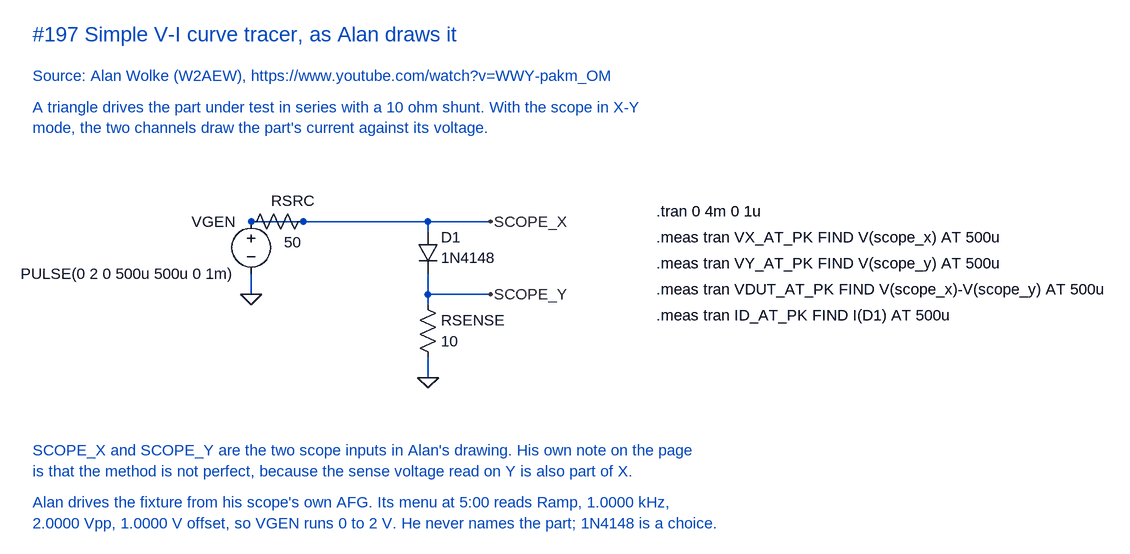
[diagram p0: schematic Diode V-I tracer.asc]
Diode V-I tracer.asc, the LTspice schematic file:
Version 4
SHEET 1 1900 1000
WIRE 496 288 576 288
WIRE 496 368 496 400
WIRE 576 288 768 288
WIRE 768 288 768 304
WIRE 768 288 864 288
WIRE 768 368 768 400
WIRE 768 400 768 416
WIRE 768 400 864 400
WIRE 768 496 768 528
FLAG 496 400 0
FLAG 768 528 0
FLAG 864 288 SCOPE_X
FLAG 864 400 SCOPE_Y
SYMBOL voltage 496 272 R0
WINDOW 0 -24 16 Right 2
WINDOW 3 -24 96 Right 2
SYMATTR InstName VGEN
SYMATTR Value PULSE(0 2 0 500u 500u 0 1m)
SYMBOL res 592 272 R90
WINDOW 0 0 32 VBottom 2
WINDOW 3 32 32 VTop 2
SYMATTR InstName RSRC
SYMATTR Value 50
SYMBOL diode 752 304 R0
WINDOW 0 36 8 Left 2
WINDOW 3 36 40 Left 2
SYMATTR InstName D1
SYMATTR Value 1N4148
SYMBOL res 752 400 R0
WINDOW 0 36 40 Left 2
WINDOW 3 36 72 Left 2
SYMATTR InstName RSENSE
SYMATTR Value 10
TEXT 160 0 Left 3 ;#197 Simple V-I curve tracer, as Alan draws it
TEXT 160 64 Left 2 ;Source: Alan Wolke (W2AEW), https://www.youtube.com/watch?v=WWY-pakm_OM
TEXT 160 112 Left 2 ;A triangle drives the part under test in series with a 10 ohm shunt. With the scope in X-Y
TEXT 160 144 Left 2 ;mode, the two channels draw the part's current against its voltage.
TEXT 1120 272 Left 2 !.tran 0 4m 0 1u
TEXT 1120 312 Left 2 !.meas tran VX_AT_PK FIND V(scope_x) AT 500u
TEXT 1120 352 Left 2 !.meas tran VY_AT_PK FIND V(scope_y) AT 500u
TEXT 1120 392 Left 2 !.meas tran VDUT_AT_PK FIND V(scope_x)-V(scope_y) AT 500u
TEXT 1120 432 Left 2 !.meas tran ID_AT_PK FIND I(D1) AT 500u
TEXT 160 640 Left 2 ;SCOPE_X and SCOPE_Y are the two scope inputs in Alan's drawing. His own note on the page
TEXT 160 672 Left 2 ;is that the method is not perfect, because the sense voltage read on Y is also part of X.
TEXT 160 720 Left 2 ;Alan drives the fixture from his scope's own AFG. Its menu at 5:00 reads Ramp, 1.0000 kHz,
TEXT 160 752 Left 2 ;2.0000 Vpp, 1.0000 V offset, so VGEN runs 0 to 2 V. He never names the part; 1N4148 is a choice.

The netlist it stands for:
* Diode V-I tracer.asc
VGEN SCOPE_X 0 PULSE(0 2 0 500u 500u 0 1m)
RSRC SCOPE_X SCOPE_X 50
D1 SCOPE_X SCOPE_Y 1N4148
RSENSE SCOPE_Y 0 10
.model D D
.lib standard.dio
* #197 Simple V-I curve tracer, as Alan draws it
* Source: Alan Wolke (W2AEW), https://www.youtube.com/watch?v=WWY-pakm_OM
* A triangle drives the part under test in series with a 10 ohm shunt. With the scope in X-Y
* mode, the two channels draw the part's current against its voltage.
.tran 0 4m 0 1u
.meas tran VX_AT_PK FIND V(scope_x) AT 500u
.meas tran VY_AT_PK FIND V(scope_y) AT 500u
.meas tran VDUT_AT_PK FIND V(scope_x)-V(scope_y) AT 500u
.meas tran ID_AT_PK FIND I(D1) AT 500u
* SCOPE_X and SCOPE_Y are the two scope inputs in Alan's drawing. His own note on the page
* is that the method is not perfect, because the sense voltage read on Y is also part of X.
* Alan drives the fixture from his scope's own AFG. Its menu at 5:00 reads Ramp, 1.0000 kHz,
* 2.0000 Vpp, 1.0000 V offset, so VGEN runs 0 to 2 V. He never names the part; 1N4148 is a choice.
.backanno
.end